# Altium project control_board_v2.PrjPcb
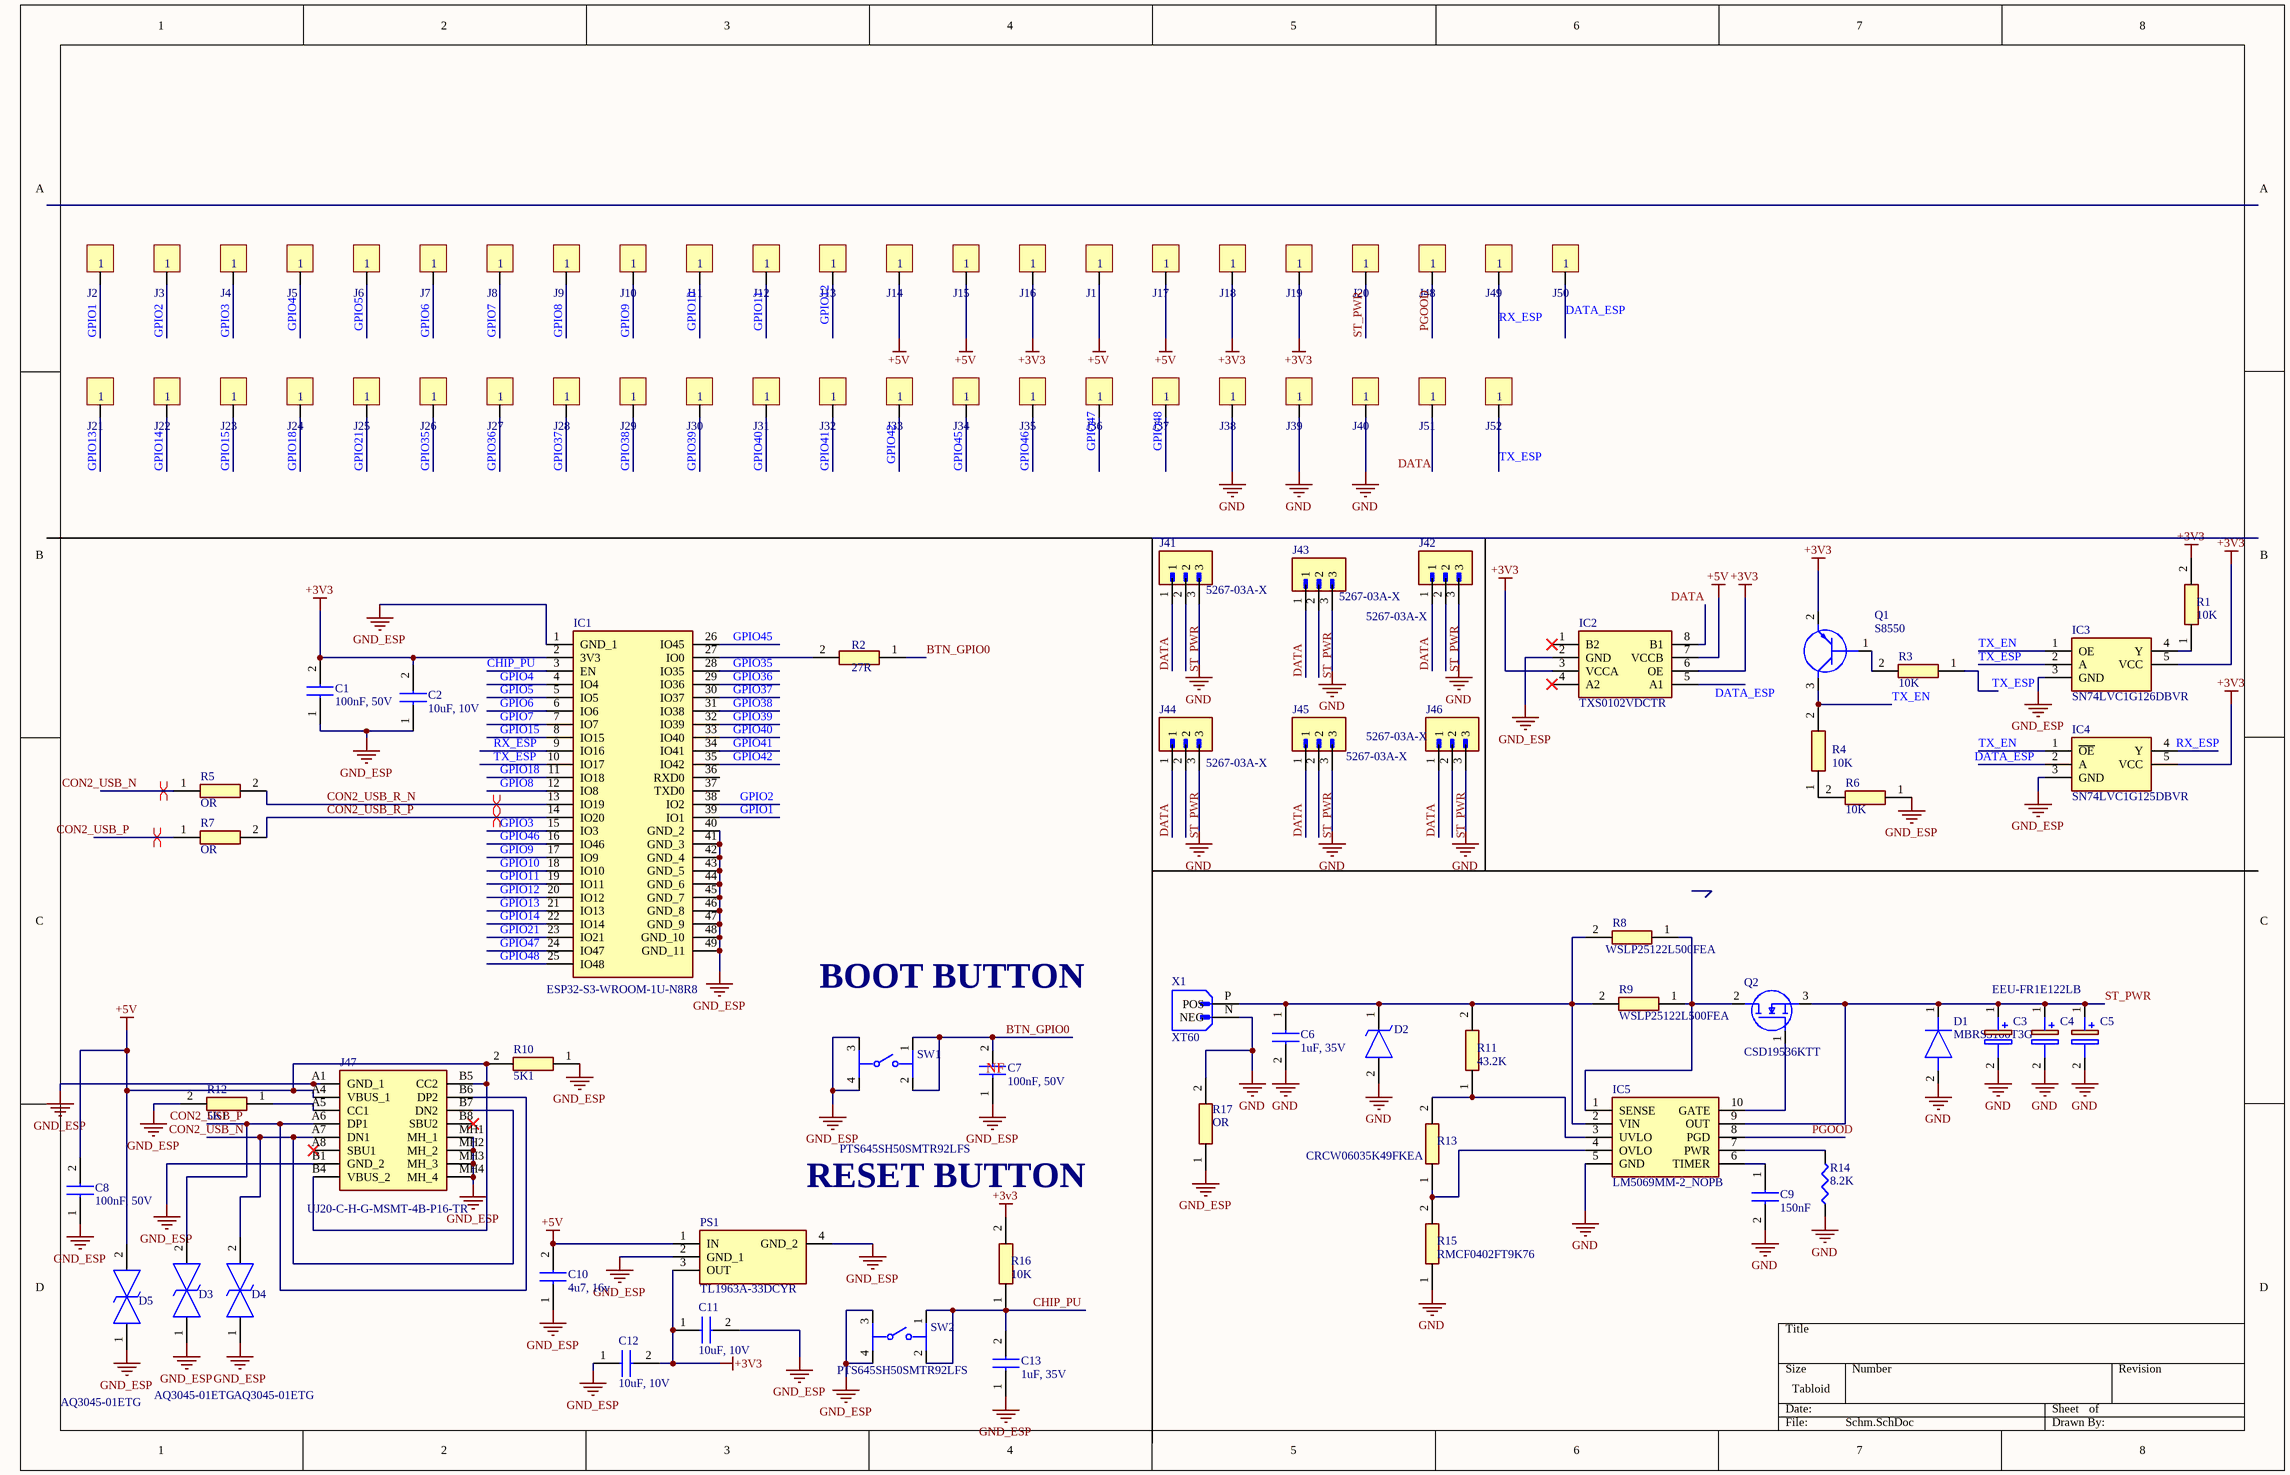
[diagram p0: Schm.SchDoc]
1 sheet, 98 parts. Net scope: global (net labels, ports and power ports of the same name join across sheets).
Board file: PCB1.PcbDoc

## Sheet Schm.SchDoc
size Tabloid; SheetNumber: 1; SheetTotal: 1

### Parts
C1  100nF, 50V  [C0402C104J4RACTU]
C2  10uF, 10V  [C0402C104J4RACTU]
C3  EEU-FR1E122LB  [CAPPRD500W65D1000H2700]  (value not drawn)
C4  EEU-FR1E122LB  [CAPPRD500W65D1000H2700]  (value not drawn)
C5  EEU-FR1E122LB  [CAPPRD500W65D1000H2700]
C6  1uF, 35V  [GRM15x]
C7  100nF, 50V  [C0402C104J4RACTU]
C8  100nF, 50V  [C0402C104J4RACTU]
C9  150nF  [CAPC1608X90N]
C10  4u7, 16v  [CAPC1608X90N]
C11  10uF, 10V  [C0402C104J4RACTU]
C12  10uF, 10V  [C0402C104J4RACTU]
C13  1uF, 35V  [GRM15x]
D1  MBRS3100T3G  [DIOM8059X261N]
D2  SMBJ15A  [DIOM5436X244N]  (value not drawn)
D3  AQ3045-01ETG  [AQ304501ETG]
D4  AQ3045-01ETG  [AQ304501ETG]
D5  AQ3045-01ETG  [AQ304501ETG]
IC1  ESP32-S3-WROOM-1U-N8R8  [ESP32S3WROOM1UN8R8]
IC2  TXS0102VDCTR  [SOP65P400X130-8N]
IC3  SN74LVC1G126DBVR  [SOT95P280X145-5N]
IC4  SN74LVC1G125DBVR  [SOT95P280X145-5N]
IC5  LM5069MM-2_NOPB  [LM5069MM-2/NOPB]
J1  1pin connector  [1 pin_conn]  (value not drawn)
J2  1pin connector  [1 pin_conn]  (value not drawn)
J3  1pin connector  [1 pin_conn]  (value not drawn)
J4  1pin connector  [1 pin_conn]  (value not drawn)
J5  1pin connector  [1 pin_conn]  (value not drawn)
J6  1pin connector  [1 pin_conn]  (value not drawn)
J7  1pin connector  [1 pin_conn]  (value not drawn)
J8  1pin connector  [1 pin_conn]  (value not drawn)
J9  1pin connector  [1 pin_conn]  (value not drawn)
J10  1pin connector  [1 pin_conn]  (value not drawn)
J11  1pin connector  [1 pin_conn]  (value not drawn)
J12  1pin connector  [1 pin_conn]  (value not drawn)
J13  1pin connector  [1 pin_conn]  (value not drawn)
J14  1pin connector  [1 pin_conn]  (value not drawn)
J15  1pin connector  [1 pin_conn]  (value not drawn)
J16  1pin connector  [1 pin_conn]  (value not drawn)
J17  1pin connector  [1 pin_conn]  (value not drawn)
J18  1pin connector  [1 pin_conn]  (value not drawn)
J19  1pin connector  [1 pin_conn]  (value not drawn)
J20  1pin connector  [1 pin_conn]  (value not drawn)
J21  1pin connector  [1 pin_conn]  (value not drawn)
J22  1pin connector  [1 pin_conn]  (value not drawn)
J23  1pin connector  [1 pin_conn]  (value not drawn)
J24  1pin connector  [1 pin_conn]  (value not drawn)
J25  1pin connector  [1 pin_conn]  (value not drawn)
J26  1pin connector  [1 pin_conn]  (value not drawn)
J27  1pin connector  [1 pin_conn]  (value not drawn)
J28  1pin connector  [1 pin_conn]  (value not drawn)
J29  1pin connector  [1 pin_conn]  (value not drawn)
J30  1pin connector  [1 pin_conn]  (value not drawn)
J31  1pin connector  [1 pin_conn]  (value not drawn)
J32  1pin connector  [1 pin_conn]  (value not drawn)
J33  1pin connector  [1 pin_conn]  (value not drawn)
J34  1pin connector  [1 pin_conn]  (value not drawn)
J35  1pin connector  [1 pin_conn]  (value not drawn)
J36  1pin connector  [1 pin_conn]  (value not drawn)
J37  1pin connector  [1 pin_conn]  (value not drawn)
J38  1pin connector  [1 pin_conn]  (value not drawn)
J39  1pin connector  [1 pin_conn]  (value not drawn)
J40  1pin connector  [1 pin_conn]  (value not drawn)
J41  5267-03A-X  [MOLEX_5267-03A-X]
J42  5267-03A-X  [MOLEX_5267-03A-X]
J43  5267-03A-X  [MOLEX_5267-03A-X]
J44  5267-03A-X  [MOLEX_5267-03A-X]
J45  5267-03A-X  [MOLEX_5267-03A-X]
J46  5267-03A-X  [MOLEX_5267-03A-X]
J47  UJ20-C-H-G-MSMT-4B-P16-TR  [UJ20CHGMSMT4BP16TR]
J48  1pin connector  [1 pin_conn]  (value not drawn)
J49  1pin connector  [1 pin_conn]  (value not drawn)
J50  1pin connector  [1 pin_conn]  (value not drawn)
J51  1pin connector  [1 pin_conn]  (value not drawn)
J52  1pin connector  [1 pin_conn]  (value not drawn)
PS1  TL1963A-33DCYR  [TL1963A-33DCYR]
Q1  S8550  [SOT95P240X110-3N]
Q2  CSD19536KTT  [CSD19536KTTT]
R1  10K  [RESC1005X40N]
R2  27R  [RESC1005X40N]
R3  10K  [RESC1005X40N]
R4  10K  [RESC1005X40N]
R5  OR  [RESC1608X50N]
R6  10K  [RESC1005X40N]
R7  OR  [RESC1608X50N]
R8  WSLP25122L500FEA  [RESC6432X89N]
R9  WSLP25122L500FEA  [RESC6432X89N]
R10  5K1  [RESC1608X60N]
R11  43.2K  [RESC2012X60N]
R12  5K1  [RESC1608X60N]
R13  CRCW06035K49FKEA  [RESC1608X50N]
R14  8.2K  [RESC1005X37N]
R15  RMCF0402FT9K76  [RESC1005X40N]
R16  10K  [RESC1005X40N]
R17  OR  [RESC1608X50N]
SW1  PTS645SH50SMTR92LFS  [FP-PTS645SH50SMTR92LFS-MFG - duplicate]
SW2  PTS645SH50SMTR92LFS  [FP-PTS645SH50SMTR92LFS-MFG - duplicate]
X1  XT60  [AMASS_XT60-M]

### Nets
+3V3: C1.2 C2.2 C11.1 C12.2 IC1.2(3V3) IC2.3(VCCA) IC2.6(OE) IC3.5(VCC) IC4.5(VCC) J16.1 J18.1 J19.1 PS1.3(OUT) Q1.2(E) R1.2 R16.2
+5V: C8.2 C10.2 D5.2 IC2.7(VCCB) J1.1 J14.1 J15.1 J17.1 J47.A4(VBUS_1) J47.B4(VBUS_2) J47.B5(CC2) PS1.1(IN) R10.2
GND: C3.2(-) C4.2(-) C5.2(-) C6.2 C9.2 D1.2(A) D2.2(A) IC5.5(GND) J38.1 J39.1 J40.1 J41.3 J42.3 J43.3 J44.3 J45.3 J46.3 R14.1 R15.1 R17.2 X1.N(NEG)
GND_ESP: C1.1 C2.1 C7.1 C8.1 C10.1 C11.2 C12.1 C13.1 D3.1 D4.1 D5.1 IC1.1(GND_1) IC1.40(GND_2) IC1.41(GND_3) IC1.42(GND_4) IC1.43(GND_5) IC1.44(GND_6) IC1.45(GND_7) IC1.46(GND_8) IC1.47(GND_9) IC1.48(GND_10) IC1.49(GND_11) IC2.2(GND) IC3.3(GND) IC4.3(GND) J47.A1(GND_1) J47.B1(GND_2) J47.MH1(MH_1) J47.MH2(MH_2) J47.MH3(MH_3) J47.MH4(MH_4) PS1.2(GND_1) PS1.4(GND_2) R6.1 R10.1 R12.2 R17.1 SW1.3 SW1.4 SW2.3 SW2.4
BTN_GPIO0: C7.2 R2.1 SW1.1 SW1.2
CHIP_PU: C13.2 IC1.3(EN) R16.1 SW2.1 SW2.2
CON2_USB_N: D4.2 J47.A7(DN1) J47.B7(DN2) R5.1
CON2_USB_P: D3.2 J47.A6(DP1) J47.B6(DP2) R7.1
CON2_USB_R_N: IC1.13(IO19) R5.2
CON2_USB_R_P: IC1.14(IO20) R7.2
DATA: IC2.8(B1) J41.1 J42.1 J43.1 J44.1 J45.1 J46.1 J51.1
DATA_ESP: IC2.5(A1) IC4.2(A) J50.1
GPIO1: IC1.39(IO1) J2.1
GPIO2: IC1.38(IO2) J3.1
GPIO3: IC1.15(IO3) J4.1
GPIO4: IC1.4(IO4) J5.1
GPIO5: IC1.5(IO5) J6.1
GPIO6: IC1.6(IO6) J7.1
GPIO7: IC1.7(IO7) J8.1
GPIO8: IC1.12(IO8) J9.1
GPIO9: IC1.17(IO9) J10.1
GPIO10: IC1.18(IO10) J11.1
GPIO11: IC1.19(IO11) J12.1
GPIO12: IC1.20(IO12) J13.1
GPIO13: IC1.21(IO13) J21.1
GPIO14: IC1.22(IO14) J22.1
GPIO15: IC1.8(IO15) J23.1
GPIO18: IC1.11(IO18) J24.1
GPIO21: IC1.23(IO21) J25.1
GPIO35: IC1.28(IO35) J26.1
GPIO36: IC1.29(IO36) J27.1
GPIO37: IC1.30(IO37) J28.1
GPIO38: IC1.31(IO38) J29.1
GPIO39: IC1.32(IO39) J30.1
GPIO40: IC1.33(IO40) J31.1
GPIO41: IC1.34(IO41) J32.1
GPIO42: IC1.35(IO42) J33.1
GPIO45: IC1.26(IO45) J34.1
GPIO46: IC1.16(IO46) J35.1
GPIO47: IC1.24(IO47) J36.1
GPIO48: IC1.25(IO48) J37.1
PGOOD: IC5.8(PGD) J48.1
RX_ESP: IC1.9(IO16) IC4.4(Y) J49.1
ST_PWR: C3.1(+) C4.1(+) C5.1(+) D1.1(K) IC5.9(OUT) J20.1 J41.2 J42.2 J43.2 J44.2 J45.2 J46.2 Q2.3(S)
TX_EN: IC3.1(OE) IC4.1(~{OE}) Q1.3(C) R4.2
TX_ESP: IC1.10(IO17) IC3.2(A) J52.1 R3.1
NetC6_1: C6.1 D2.1(K) IC5.2(VIN) R8.2 R9.2 R11.2 X1.P(POS)
NetC9_1: C9.1 IC5.6(TIMER)
NetIC1_27: IC1.27(IO0) R2.2
NetIC3_4: IC3.4(Y) R1.1
NetIC5_1: IC5.1(SENSE) Q2.2(D) R8.1 R9.1
NetIC5_3: IC5.3(UVLO) R11.1 R13.2
NetIC5_4: IC5.4(OVLO) R13.1 R15.2
NetIC5_7: IC5.7(PWR) R14.2
NetIC5_10: IC5.10(GATE) Q2.1(G)
NetJ47_A5: J47.A5(CC1) R12.1
NetQ1_1: Q1.1(B) R3.2
NetR4_1: R4.1 R6.2

Not connected (* = marked no-connect by the designer): IC1 36(RXD0) 37(TXD0); IC2 1(B2)* 4(A2)*; J47 A8(SBU1)* B8(SBU2)*

### Layout directives
differential pair: CON2_USB_N, CON2_USB_P, CON2_USB_R_N, CON2_USB_R_P

### Notes on the sheet
- BOOT BUTTON
- (near C7) NF
- RESET BUTTON

### Library data of the parts
C1 C7 C8 = E0402X7R104K500NTB: 100 nF 10% 50V Ceramic Capacitor X7R 0402 (1005 Metric); Manufacturer_Name: Yageo Group; Manufacturer_Part_Number: C0402C101G3GALTU; Datasheet Link: https://content.kemet.com/datasheets/KEM_C1002_X7R_SMD.pdf; Height: 0.55mm
C2 C11 C12 = CL21A106KPFNNNF: Cap Ceramic 10uF 10V X5R 10% SMD 0805 85C Embossed T/R; Manufacturer_Name: Yageo Group; Manufacturer_Part_Number: C0402C101G3GALTU; Height: 0.55mm; Datasheet Link: https://content.kemet.com/datasheets/KEM_C1002_X7R_SMD.pdf
C3-C5 = EEU-FR1E122LB: Capacitor Polarised; Manufacturer_Name: Panasonic; Datasheet Link: http://industrial.panasonic.com/cdbs/www-data/pdf/RDF0000/ABA0000C1259.pdf; Height: 27mm; Manufacturer_Part_Number: EEU-FR1E122LB; Mouser Part Number: 667-EEU-FR1E122LB; Mouser Price/Stock: https://www.mouser.com/Search/Refine.aspx?Keyword=667-EEU-FR1E122LB
C6 C13 = GRM155R6YA105ME11D: Capacitor; Manufacturer_Name: Murata Electronics; Height: 0.33mm; Datasheet Link: https://search.murata.co.jp/Ceramy/image/img/A01X/G101/ENG/GRM155R6YA105ME11-01A.pdf; Manufacturer_Part_Number: GRM155R6YA105ME11D; Mouser Part Number: 81-GRM155R6YA105ME1D; Mouser Price/Stock: https://www.mouser.com/Search/Refine.aspx?Keyword=81-GRM155R6YA105ME1D; Arrow Part Number: GRM155R6YA105ME11D; Arrow Price/Stock: https://www.arrow.com/en/products/grm155r6ya105me11d/murata-manufacturing
C9 = 06033D224MAT2A: Multilayer Ceramic Capacitors MLCC - SMD/SMT KGM15BR51E224MT NEW GLOBAL PN 25V .22uF A 581-; Manufacturer_Name: Kyocera AVX; Datasheet Link: https://componentsearchengine.com/Datasheets/1/06031A100FAT2A.pdf; Height: 0.9mm; Manufacturer_Part_Number: 06033D224MAT2A; Mouser Part Number: 581-06033D224MAT2A; Mouser Price/Stock: https://www.mouser.co.uk/ProductDetail/KYOCERA-AVX/06033D224MAT2A?qs=VsusWq3clnxkz0k6zqAqqQ%3D%3D
C10 = grm188z71c475ke21d: Capacitor; Manufacturer_Name: SAMSUNG; Manufacturer_Part_Number: CL10A475KO8NNNC; Height: 0.9mm; Datasheet Link: https://rs.componentsearchengine.com/Datasheets/2/CL10A475KO8NNNC.pdf; Mouser Part Number: 187-CL10A475KO8NNNC; Mouser Price/Stock: https://www.mouser.co.uk/ProductDetail/Samsung-Electro-Mechanics/CL10A475KO8NNNC?qs=X6jEic%2FHinAbIjmLnFfqqQ%3D%3D; Arrow Part Number: CL10A475KO8NNNC; Arrow Price/Stock: https://www.arrow.com/en/products/cl10a475ko8nnnc/samsung-electro-mechanics.html?utm_currency=USD&region=nac
D1 = MBRS3100T3G: Diode; Manufacturer_Name: onsemi; Datasheet Link: https://www.onsemi.com/pub/Collateral/MBRS3100T3-D.PDF; Height: 2.61mm; Manufacturer_Part_Number: MBRS3100T3G; Mouser Part Number: 863-MBRS3100T3G; Mouser Price/Stock: https://www.mouser.co.uk/ProductDetail/onsemi/MBRS3100T3G?qs=3JMERSakebrbkNtjl3tdRw%3D%3D; Arrow Part Number: MBRS3100T3G; Arrow Price/Stock: https://www.arrow.com/en/products/mbrs3100t3g/on-semiconductor?utm_currency=USD&region=nac
D2 = SMBJ15A: TVS Diode (Uni-directional); Manufacturer_Name: Vishay; Datasheet Link: http://www.vishay.com/docs/88392/smbj.pdf; Height: 2.44mm; Manufacturer_Part_Number: SMBJ15A; Mouser Part Number: 78-SMBJ15A; Mouser Price/Stock: https://www.mouser.co.uk/ProductDetail/Vishay-General-Semiconductor/SMBJ15A?qs=%252BA9HMDDz5KavBY56EO7ceQ%3D%3D
D3-D5 = AQ3045-01ETG: TVS Diode (Bi-directional); Manufacturer_Name: LITTELFUSE; Datasheet Link: http://m.littelfuse.com/~/media/electronics/datasheets/tvs_diode_arrays/littelfuse_tvs_diode_array_aq3045_datasheet.pdf.pdf; Height: 0.42mm; Manufacturer_Part_Number: AQ3045-01ETG; Mouser Part Number: 576-AQ3045-01ETG; Mouser Price/Stock: https://www.mouser.co.uk/ProductDetail/Littelfuse/AQ3045-01ETG?qs=lM4gFlnEeEMEfe%252B5jSw4OA%3D%3D; Arrow Part Number: AQ3045-01ETG; Arrow Price/Stock: https://www.arrow.com/en/products/aq3045-01etg/littelfuse.html?utm_currency=USD&region=nac
IC1 = ESP32-S3-WROOM-1U-N8R8: Integrated Circuit; Manufacturer_Name: Espressif Systems; Datasheet Link: https://www.espressif.com/sites/default/files/documentation/esp32-s3-wroom-1_wroom-1u_datasheet_en.pdf; Height: 3.35mm; Manufacturer_Part_Number: ESP32-S3-WROOM-1U-N8R8; Mouser Part Number: 356-ESP32S3WRM1UN8R8; Mouser Price/Stock: https://www.mouser.co.uk/ProductDetail/Espressif-Systems/ESP32-S3-WROOM-1U-N8R8?qs=Li%252BoUPsLEnvOglIa3CypaQ%3D%3D
IC2 = TXS0102VDCTR: Integrated Circuit; Manufacturer_Name: Texas Instruments; Datasheet Link: https://www.ti.com/lit/ds/symlink/txs0102v.pdf?ts=1736527127556&ref_url=https%253A%252F%252Fwww.ti.com%252Flogic-voltage-translation%252Fvoltage-translators-level-shifters%252Fproducts.html; Height: 1.3mm; Manufacturer_Part_Number: TXS0102VDCTR; Mouser Part Number: 595-TXS0102VDCTR; Mouser Price/Stock: https://www.mouser.co.uk/ProductDetail/Texas-Instruments/TXS0102VDCTR?qs=olJun0bQHM%2FUS3bAIjbB0A%3D%3D; Arrow Part Number: TXS0102VDCTR; Arrow Price/Stock: https://www.arrow.com/en/products/txs0102vdctr/texas-instruments?utm_currency=USD&region=nac
IC3 = SN74LVC1G126DBVR: Integrated Circuit; Manufacturer_Name: Texas Instruments; Datasheet Link: http://www.ti.com/lit/ds/symlink/sn74lvc1g126.pdf; Height: 1.45mm; Manufacturer_Part_Number: SN74LVC1G126DBVR; Mouser Part Number: 595-SN74LVC1G126DBVR; Mouser Price/Stock: https://www.mouser.co.uk/ProductDetail/Texas-Instruments/SN74LVC1G126DBVR?qs=pajgIaoyDUi3T2WgNNfd3w%3D%3D; Arrow Part Number: SN74LVC1G126DBVR; Arrow Price/Stock: https://www.arrow.com/en/products/sn74lvc1g126dbvr/texas-instruments.html?utm_currency=USD&region=nac
IC4 = SN74LVC1G125DBVR: Integrated Circuit; Manufacturer_Name: Texas Instruments; Datasheet Link: http://www.ti.com/lit/ds/symlink/sn74lvc1g125.pdf; Height: 1.45mm; Manufacturer_Part_Number: SN74LVC1G125DBVR; Mouser Part Number: 595-SN74LVC1G125DBVR; Mouser Price/Stock: https://www.mouser.co.uk/ProductDetail/Texas-Instruments/SN74LVC1G125DBVR?qs=dT9u2OTAaVWCjkJK89JQQg%3D%3D; Arrow Part Number: SN74LVC1G125DBVR; Arrow Price/Stock: https://www.arrow.com/en/products/sn74lvc1g125dbvr/texas-instruments.html?utm_currency=USD&region=asia
IC5 = LM5069MM-2_NOPB: Integrated Circuit; Manufacturer_Name: Texas Instruments; Datasheet Link: http://www.ti.com/lit/gpn/lm5069; Height: 1.1mm; Manufacturer_Part_Number: LM5069MM-2/NOPB; Mouser Part Number: 926-LM5069MM-2/NOPB; Mouser Price/Stock: https://www.mouser.co.uk/ProductDetail/Texas-Instruments/LM5069MM-2-NOPB?qs=QbsRYf82W3EdgSJlau%252Bfzw%3D%3D; Arrow Part Number: LM5069MM-2/NOPB; Arrow Price/Stock: https://www.arrow.com/en/products/lm5069mm-2nopb/texas-instruments.html?utm_currency=USD&region=nac
J1-J40 J48-J52 = 1pin connector: Board Connector, 1 Contact(s), 1 Row(s), Female, Straight, Solder Terminal, Black Insulator, Receptacle; GPIO_Net: *
J41-J46 = 5267-03A-X: CONN HEADER TH 3POS 2.5mm; MF: Molex; SnapEDA_Link: https://www.snapeda.com/parts/5267-03A-X/Molex/view-part/?ref=snap; Package: None; Value: *; MP: 5267-03A-X; Check_prices: https://www.snapeda.com/parts/5267-03A-X/Molex/view-part/?ref=eda
J47 = UJ20-C-H-G-MSMT-4B-P16-TR: Connector; Manufacturer_Name: Same Sky; Datasheet Link: https://www.sameskydevices.com/product/resource/uj20-c-h-g-msmt-4b-p16-tr.pdf; Height: 2.6mm; Manufacturer_Part_Number: UJ20-C-H-G-MSMT-4B-P16-TR
PS1 = TL1963A-33DCYR: Power Supply; Manufacturer_Name: Texas Instruments; Datasheet Link: http://www.ti.com/lit/gpn/tl1963a; Height: 1.8mm; Manufacturer_Part_Number: TL1963A-33DCYR; Mouser Part Number: 595-TL1963A-33DCYR; Mouser Price/Stock: https://www.mouser.co.uk/ProductDetail/Texas-Instruments/TL1963A-33DCYR?qs=IK5e5L0zOXhRu%2FNTAfJNEA%3D%3D; Arrow Part Number: TL1963A-33DCYR; Arrow Price/Stock: https://www.arrow.com/en/products/tl1963a-33dcyr/texas-instruments?utm_currency=USD&region=nac
Q1 = S8550: Transistor BJT PNP; Manufacturer_Name: Galaxy; Datasheet Link: https://datasheet.datasheetarchive.com/originals/distributors/Datasheets-3/DSA-49109.pdf; Height: 1.1mm; Manufacturer_Part_Number: S8550
Q2 = CSD19536KTT: MOSFET (N-Channel); Manufacturer_Name: Texas Instruments; Datasheet Link: http://www.ti.com/lit/gpn/csd19536ktt; Manufacturer_Part_Number: CSD19536KTT; Mouser Part Number: 595-CSD19536KTT; Mouser Price/Stock: https://www.mouser.co.uk/ProductDetail/Texas-Instruments/CSD19536KTT?qs=MiqG6Kq1qKP2NIsb3jZrDg%3D%3D; Arrow Part Number: CSD19536KTT; Arrow Price/Stock: https://www.arrow.com/en/products/csd19536ktt/texas-instruments.html?utm_currency=USD&region=nac
R1 R3 R4 R6 R16 = MC00625W0402110K: Res General Purpose Thick Film 0402 10k Ohm 1% 1/16W 100ppm/C Molded; Manufacturer_Name: Multicomp Pro; Height: 0.4mm; Datasheet Link: http://www.farnell.com/datasheets/2140393.pdf?_ga=1.247542791.1411154270.1472651675; Manufacturer_Part_Number: MC00625W0402110K
R2 = RMCF0402FT27R0: Manufacturer_Name: Yageo Group; Manufacturer_Part_Number: RC0402FR-0727RL; Height: 0.4mm; Datasheet Link: https://www.yageogroup.com/content/datasheet/asset/file/PYU-RC_GROUP_51_ROHS_L; Mouser Part Number: 603-RC0402FR-0727RL; Mouser Price/Stock: https://www.mouser.co.uk/ProductDetail/YAGEO/RC0402FR-0727RL?qs=UOUeRUa%252B8Wlb37UyFHw9Bw%3D%3D; Arrow Part Number: RC0402FR-0727RL; Arrow Price/Stock: https://www.arrow.com/en/products/rc0402fr-0727rl/yageo.html?utm_currency=USD&region=nac
R5 R7 R17 = CRCW06030000Z0EC: Resistor; Manufacturer_Name: Vishay; Height: 0.5mm; Datasheet Link: http://www.vishay.com/docs/20035/dcrcwe3.pdf; Manufacturer_Part_Number: CRCW06030000Z0EC; Mouser Part Number: 71-CRCW06030000Z0EC; Mouser Price/Stock: https://www.mouser.co.uk/ProductDetail/Vishay-Dale/CRCW06030000Z0EC?qs=5Vo7YKalRVV5nT3RQodYAA%3D%3D; Arrow Part Number: CRCW06030000Z0EC; Arrow Price/Stock: https://www.arrow.com/en/products/crcw06030000z0ec/vishay?utm_currency=USD&region=nac
R8 R9 = WSLP25122L500FEA: Fixed Resistor, Metal Strip, 3W, 0.0025ohm, 0.0866V, 1% +/-Tol, 275ppm/Cel, Surface Mount, 2512; Manufacturer_Name: Vishay; Height: 0.889mm; Datasheet Link: https://componentsearchengine.com/Datasheets/1/WSLP25122L500FEA.pdf; Manufacturer_Part_Number: WSLP25122L500FEA; Mouser Part Number: 71-WSLP25122L500FEA; Mouser Price/Stock: https://www.mouser.co.uk/ProductDetail/Vishay-Dale/WSLP25122L500FEA?qs=%2FCXICPRLKg%252BpcyljWM%2FHhA%3D%3D; Arrow Part Number: WSLP25122L500FEA; Arrow Price/Stock: https://www.arrow.com/en/products/wslp25122l500fea/vishay?utm_currency=USD&region=nac
R10 R12 = MCWR06X5101FTL: Res Thick Film 0603 5.1K Ohm 1% 0.1W(1/10W) 100ppm/C Pad SMD T/R; Manufacturer_Name: Multicomp Pro; Height: 0.6mm; Datasheet Link: https://4donline.ihs.com/images/VipMasterIC/IC/SCMP/SCMP-S-A0009547702/SCMP-S-A0009547702-1.pdf?hkey=6D3A4C79FDBF58556ACFDE234799DDF0; Manufacturer_Part_Number: MCWR06X5101FTL
R11 = CR0805-FX-4322ELF: Res Thick Film 0805 43.2K Ohm 1% 1/8W 100ppm/C Molded SMD SMD Paper Tape on Plastic Reel; Manufacturer_Name: Bourns; Height: 0.6mm; Datasheet Link: https://www.bourns.com/pdfs/chpreztr.pdf; Manufacturer_Part_Number: CR0805-FX-4322ELF; Mouser Part Number: 652-CR0805FX-4322ELF; Mouser Price/Stock: https://www.mouser.co.uk/ProductDetail/Bourns/CR0805-FX-4322ELF?qs=TYKCbaKwe1AoFj9Z1kLM%2Fw%3D%3D
R13 = CRCW06035K49FKEA: Res Thick Film 0603 5.49K Ohm 1% 0.1W(1/10W) 100ppm/C Pad SMD T/R Automotive AEC-Q200; Manufacturer_Name: Vishay; Height: 0.5mm; Datasheet Link: http://www.vishay.com/docs/20035/dcrcwe3.pdf; Manufacturer_Part_Number: CRCW06035K49FKEA; Mouser Part Number: 71-CRCW0603-5.49K-E3; Mouser Price/Stock: https://www.mouser.co.uk/ProductDetail/Vishay-Dale/CRCW06035K49FKEA?qs=C0yavoHm3BmrHuoVQmHL9Q%3D%3D
R14 = AC0402FRE0710KL: Thin Film Resistors - SMD MCT 0603-50 1% P5 10K2; Manufacturer: Yageo Group; Power Dissipation: 62.5mW; Value: 10kΩ; Temperature Coefficient: 50ppm/°C; Working Voltage: 50V; Supplier: DigiKey; Supplier Part Number: 13-AC0402FRE0710KLCT-ND; Manufacturer Part Number: AC0402FRE0710KL; RoHS: Compliant; Category: Chip SMD Resistors; Stock: 4000; Pricing: 1=0.1, 10=0.037, 25=0.0276, 50=0.0226, 100=0.0186, 250=0.01476, 500=0.01256, 1000=0.01081, 5000=0.00806 (USD); Case/Package: 0402; China RoHS: Non-Compliant; Height: 320µm; Lifecycle Status: Production; Max Operating Temperature: 155°C; Min Operating Temperature: -55°C; Mounting Technology: Surface Mount; Number of Terminals: 2; Packaging: Tape & Reel; REACH SVHC: Yes; Tolerance: 1%; Width: 500µm; ComponentLink1URL: https://datasheet.octopart.com:443/AC0402FRE0710KL-Yageo-datasheet-182189378.pdf?src-supplier=IHS; ComponentLink1Description: https://datasheet.octopart.com:443/AC0402FRE0710KL-Yageo-datasheet-182189378.pdf?src-supplier=IHS; ComponentLink2URL: https://datasheet.octopart.com/AC0402FRE0710KL-Yageo-datasheet-12512238.pdf; ComponentLink2Description: https://datasheet.octopart.com/AC0402FRE0710KL-Yageo-datasheet-12512238.pdf; ComponentLink3URL: http://sigma.octopart.com:80/rohs_statement/Yageo-company-2.pdf?src-supplier=Compliance+Statements; ComponentLink3Description: http://sigma.octopart.com:80/rohs_statement/Yageo-company-2.pdf?src-supplier=Compliance+Statements; ComponentLink4URL: http://sigma.octopart.com:80/conflict_mineral_statement/Yageo-company-3.pdf?src-supplier=Compliance+Statements; ComponentLink4Description: http://sigma.octopart.com:80/conflict_mineral_statement/Yageo-company-3.pdf?src-supplier=Compliance+Statements; LCSC Part Number: C7209924
R15 = RMCF0402FT9K76: Res Thick Film 0402 9.76K Ohm 1% 0.063W 100ppm/C Molded SMD Paper T/R; Manufacturer_Name: Stackpole Electronics; Height: 0.4mm; Datasheet Link: https://cs.seielect.com/catalog/SEI-RMCF_RMCP.pdf; Manufacturer_Part_Number: RMCF0402FT9K76
SW1 SW2 = PTS645SH50SMTR92LFS: SWITCH TACTILE SPST-NO 0.05A 12V; Manufacturer: C&K Components; Actuator Material: Nylon, Polyamide; Contact Current Rating: 50mA; Contact Resistance: 100mΩ; Electrical Life: 100kcycles; Illumination Type: Illuminated, Non-Illuminated; Insulation Resistance: 100GΩ; Number of Positions: 1; Operating Force: 1.96N; Switch Function: Off-Mom; Throw Configuration: SPST; Supplier: DigiKey; Supplier Part Number: CKN9085CT-ND; Manufacturer Part Number: PTS645SH50SMTR92LFS; RoHS: Compliant; Category: Tactile Switches; Stock: 7683; Pricing: 1=0.35, 10=0.3, 25=0.2804, 100=0.251, 250=0.23256, 500=0.21948, 1000=0.20725, 2000=0.19599, 3000=0.18986, 5000=0.18265, 7000=0.1782, 10000=0.17375, 25000=0.16349, 50000=0.15681 (USD); Case/Package: SMD/SMT; Color: Black; Contact Material: Bronze; Contact Plating: Silver; Current Rating: 50mA; Depth: 9mm; Height: 3.4544mm; Lead Free: Lead Free; Length: 6mm; Life (Cycles): 100kcycles; Lifecycle Status: Production; Max Current Rating: 50mA; Max Operating Temperature: 60°C; Max Voltage Rating (DC): 12V; Mechanical Life: 100kcycles; Min Operating Temperature: -20°C; Mounting Technology: Surface Mount; Orientation: Straight; Packaging: Tape & Reel (TR); REACH SVHC: Yes; Termination: Gull Wing; Voltage Rating (DC): 12V; ComponentLink1URL: https://datasheet.octopart.com:443/PTS645SH50SMTR92LFS-C%26K-Components-datasheet-169841344.pdf?src-supplier=Farnell; ComponentLink1Description: https://datasheet.octopart.com:443/PTS645SH50SMTR92LFS-C%26K-Components-datasheet-169841344.pdf?src-supplier=Farnell; ComponentLink2URL: https://datasheet.octopart.com:443/PTS645SH50SMTR92LFS-C%26K-Components-datasheet-165782998.pdf?src-supplier=Farnell; ComponentLink2Description: https://datasheet.octopart.com:443/PTS645SH50SMTR92LFS-C%26K-Components-datasheet-165782998.pdf?src-supplier=Farnell; ComponentLink3URL: https://datasheet.octopart.com:443/PTS645SH50SMTR92LFS-C%26K-Components-datasheet-67873720.pdf?src-supplier=Upverter; ComponentLink3Description: https://datasheet.octopart.com:443/PTS645SH50SMTR92LFS-C%26K-Components-datasheet-67873720.pdf?src-supplier=Upverter; ComponentLink4URL: https://datasheet.octopart.com:443/PTS645SH50SMTR92-LFS-C%26K-Components-datasheet-141421486.pdf?src-supplier=Upverter; ComponentLink4Description: https://datasheet.octopart.com:443/PTS645SH50SMTR92-LFS-C%26K-Components-datasheet-141421486.pdf?src-supplier=Upverter; ComponentLink5URL: https://datasheet.octopart.com:443/PTS645SH50SMTR92-LFS-C%26K-Components-datasheet-110647872.pdf?src-supplier=TME; ComponentLink5Description: https://datasheet.octopart.com:443/PTS645SH50SMTR92-LFS-C%26K-Components-datasheet-110647872.pdf?src-supplier=TME; ComponentLink6URL: https://datasheet.octopart.com:443/PTS645SH50SMTR-92-LFS-C%26K-Components-datasheet-150821959.pdf?src-supplier=TME; ComponentLink6Description: https://datasheet.octopart.com:443/PTS645SH50SMTR-92-LFS-C%26K-Components-datasheet-150821959.pdf?src-supplier=TME; ComponentLink7URL: https://datasheet.octopart.com:443/PTS645SH50SMTR92LFS-C%26K-Components-datasheet-138128951.pdf?src-supplier=Future+Electronics; ComponentLink7Description: https://datasheet.octopart.com:443/PTS645SH50SMTR92LFS-C%26K-Components-datasheet-138128951.pdf?src-supplier=Future+Electronics; ComponentLink8URL: https://datasheet.octopart.com:443/PTS645SH50SMTR92LFS-C%26K-Components-datasheet-62111174.pdf?src-supplier=Future+Electronics; ComponentLink8Description: https://datasheet.octopart.com:443/PTS645SH50SMTR92LFS-C%26K-Components-datasheet-62111174.pdf?src-supplier=Future+Electronics; ComponentLink9URL: https://datasheet.octopart.com:443/PTS645SH50SMTR92LFS-C%26K-Components-datasheet-24578962.pdf?src-supplier=Future+Electronics; ComponentLink9Description: https://datasheet.octopart.com:443/PTS645SH50SMTR92LFS-C%26K-Components-datasheet-24578962.pdf?src-supplier=Future+Electronics; ComponentLink10URL: https://datasheet.octopart.com:443/PTS645SH50SMTR92-LFS-C%26K-Components-datasheet-12590747.pdf?src-supplier=Future+Electronics; ComponentLink10Description: https://datasheet.octopart.com:443/PTS645SH50SMTR92-LFS-C%26K-Components-datasheet-12590747.pdf?src-supplier=Future+Electronics; LCSC Part Number: C221869
X1 = FIT0587: High Quality Gold Plated XT60 Male and amp, Female Bullet Connector; Manufacturer: DFRobot; Supplier: DigiKey; Supplier Part Number: 1738-1437-ND; Manufacturer Part Number: FIT0587; Category: Uncategorized; Stock: 5338; Pricing: 1=1.5 (USD); RoHS: Non-Compliant